# Altium project BGA_RF-ArticGR.PrjPcb
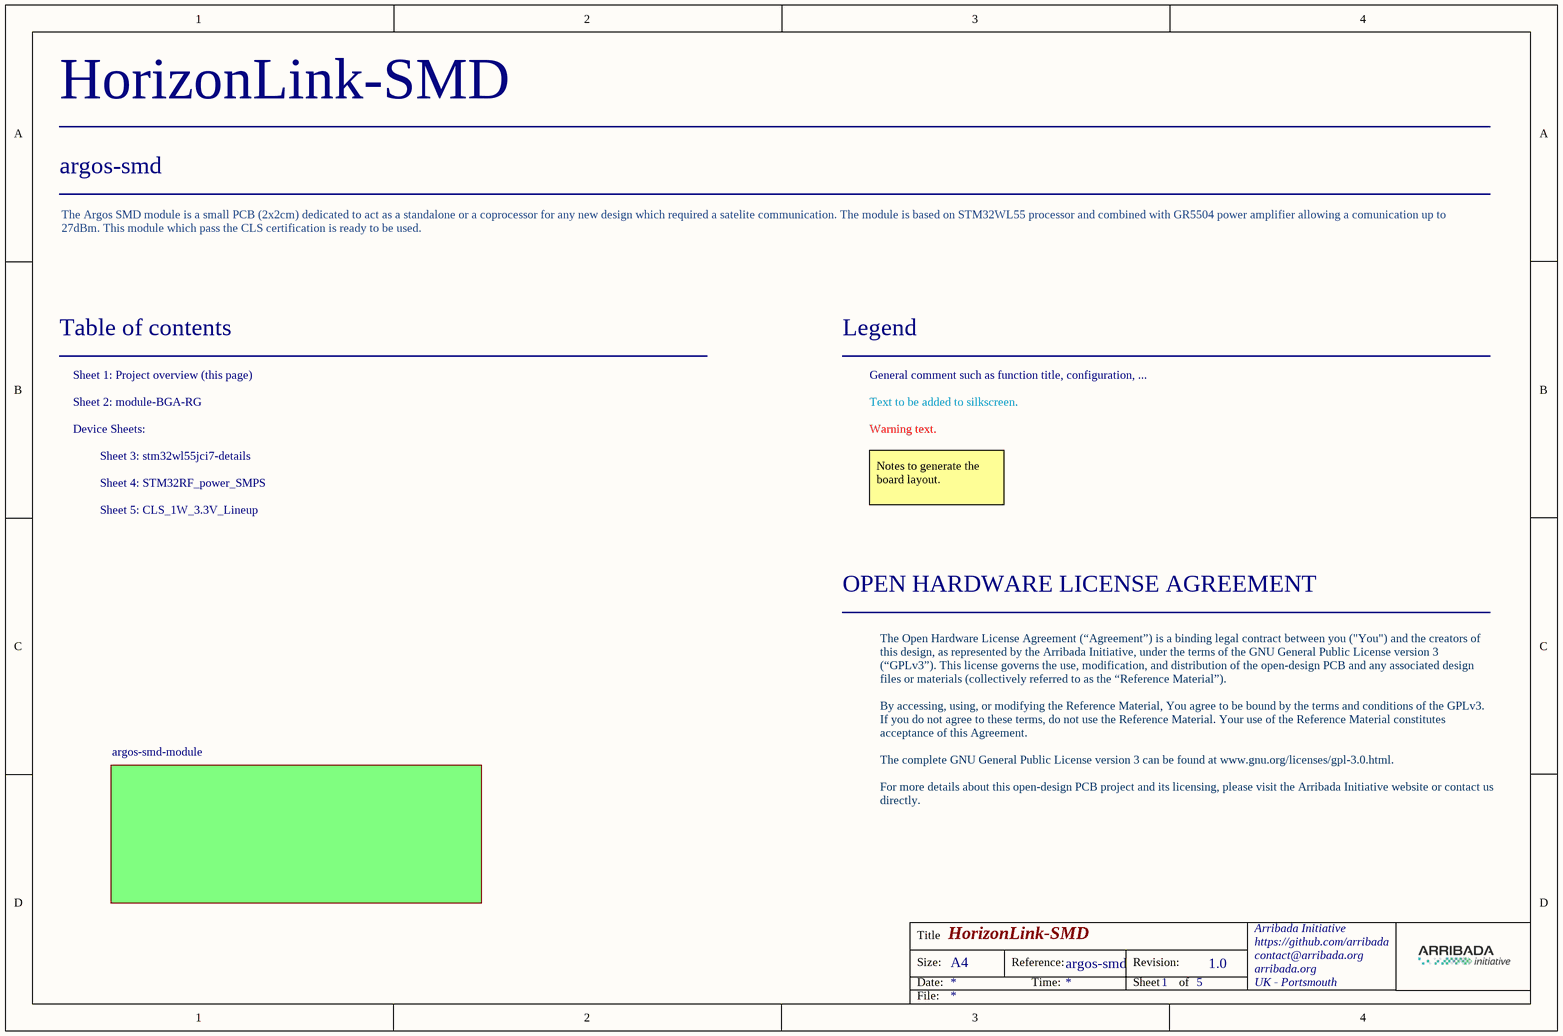
[diagram p0: Project_Overview.SchDoc]
Board_Assembly_Revision: 1.0; Board_Document_Date: 06/2024; Board_Name: HorizonLink-SMD; Board_Reference: argos-smd
2 sheets, 18 parts. Net scope: global (net labels, ports and power ports of the same name join across sheets).
Board file: module-BGA_RG-4layers_v2.1.PcbDoc
Sheets:
  Project_Overview.SchDoc
    argos-smd-module = module-BGA-RG.SchDoc

## Sheet Project_Overview.SchDoc
size A4; Organization: Arribada Initiative; Address1: https://github.com/arribada; Address2: contact@arribada.org; Address3: arribada.org; Address4: UK - Portsmouth; DocumentNumber: 1; SheetNumber: 1; SheetTotal: 5

### Sub-sheets
argos-smd-module = module-BGA-RG.SchDoc: no entries

### Notes on the sheet
- The Argos SMD module is a small PCB (2x2cm) dedicated to act as a standalone or a coprocessor for any new design which required a satelite communication. The module is based on STM32WL55 processor and combined with GR5504 power amplifier allowing a comunication up to 27dBm. This module which pass the CLS certification is ready to be used.
- Table of contents
- Sheet 1: Project overview (this page)
- Legend
- General comment such as function title, configuration, ...
- Sheet 2: module-BGA-RG
- Device Sheets:
- Text to be added to silkscreen.
- Warning text.
- Sheet 3: stm32wl55jci7-details
- Sheet 5: CLS_1W_3.3V_Lineup
- Sheet 4: STM32RF_power_SMPS
- Notes to generate the board layout.
- OPEN HARDWARE LICENSE AGREEMENT
- The Open Hardware License Agreement (“Agreement”) is a binding legal contract between you ("You") and the creators of this design, as represented by the Arribada Initiative, under the terms of the GNU General Public License version 3 (“GPLv3”). This license governs the use, modification, and distribution of the open-design PCB and any associated design files or materials (collectively referred to as the “Reference Material”).
  By accessing, using, or modifying the Reference Material, You agree to be bound by the terms and conditions of the GPLv3. If you do not agree to these terms, do not use the Reference Material. Your use of the Reference Material constitutes acceptance of this Agreement.
  The complete GNU General Public License version 3 can be found at www.gnu.org/licenses/gpl-3.0.html.
  For more details about this open-design PCB project and its licensing, please visit the Arribada Initiative website or contact us directly.
- Title
- Size:
- Date:
- A4
- Reference:
- Time:
- Revision:
- Sheet
- of
- File:

## Sheet module-BGA-RG.SchDoc
size A3; DocumentNumber: 2; SheetNumber: 2; SheetTotal: 5; Organization: Arribada Initiative; Address1: https://github.com/arribada; Address2: contact@arribada.org; Address3: arribada.org; Address4: UK - Porthmouth
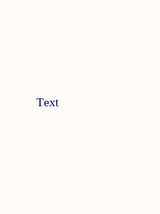
[diagram p1: module-BGA-RG.SchDoc, left]
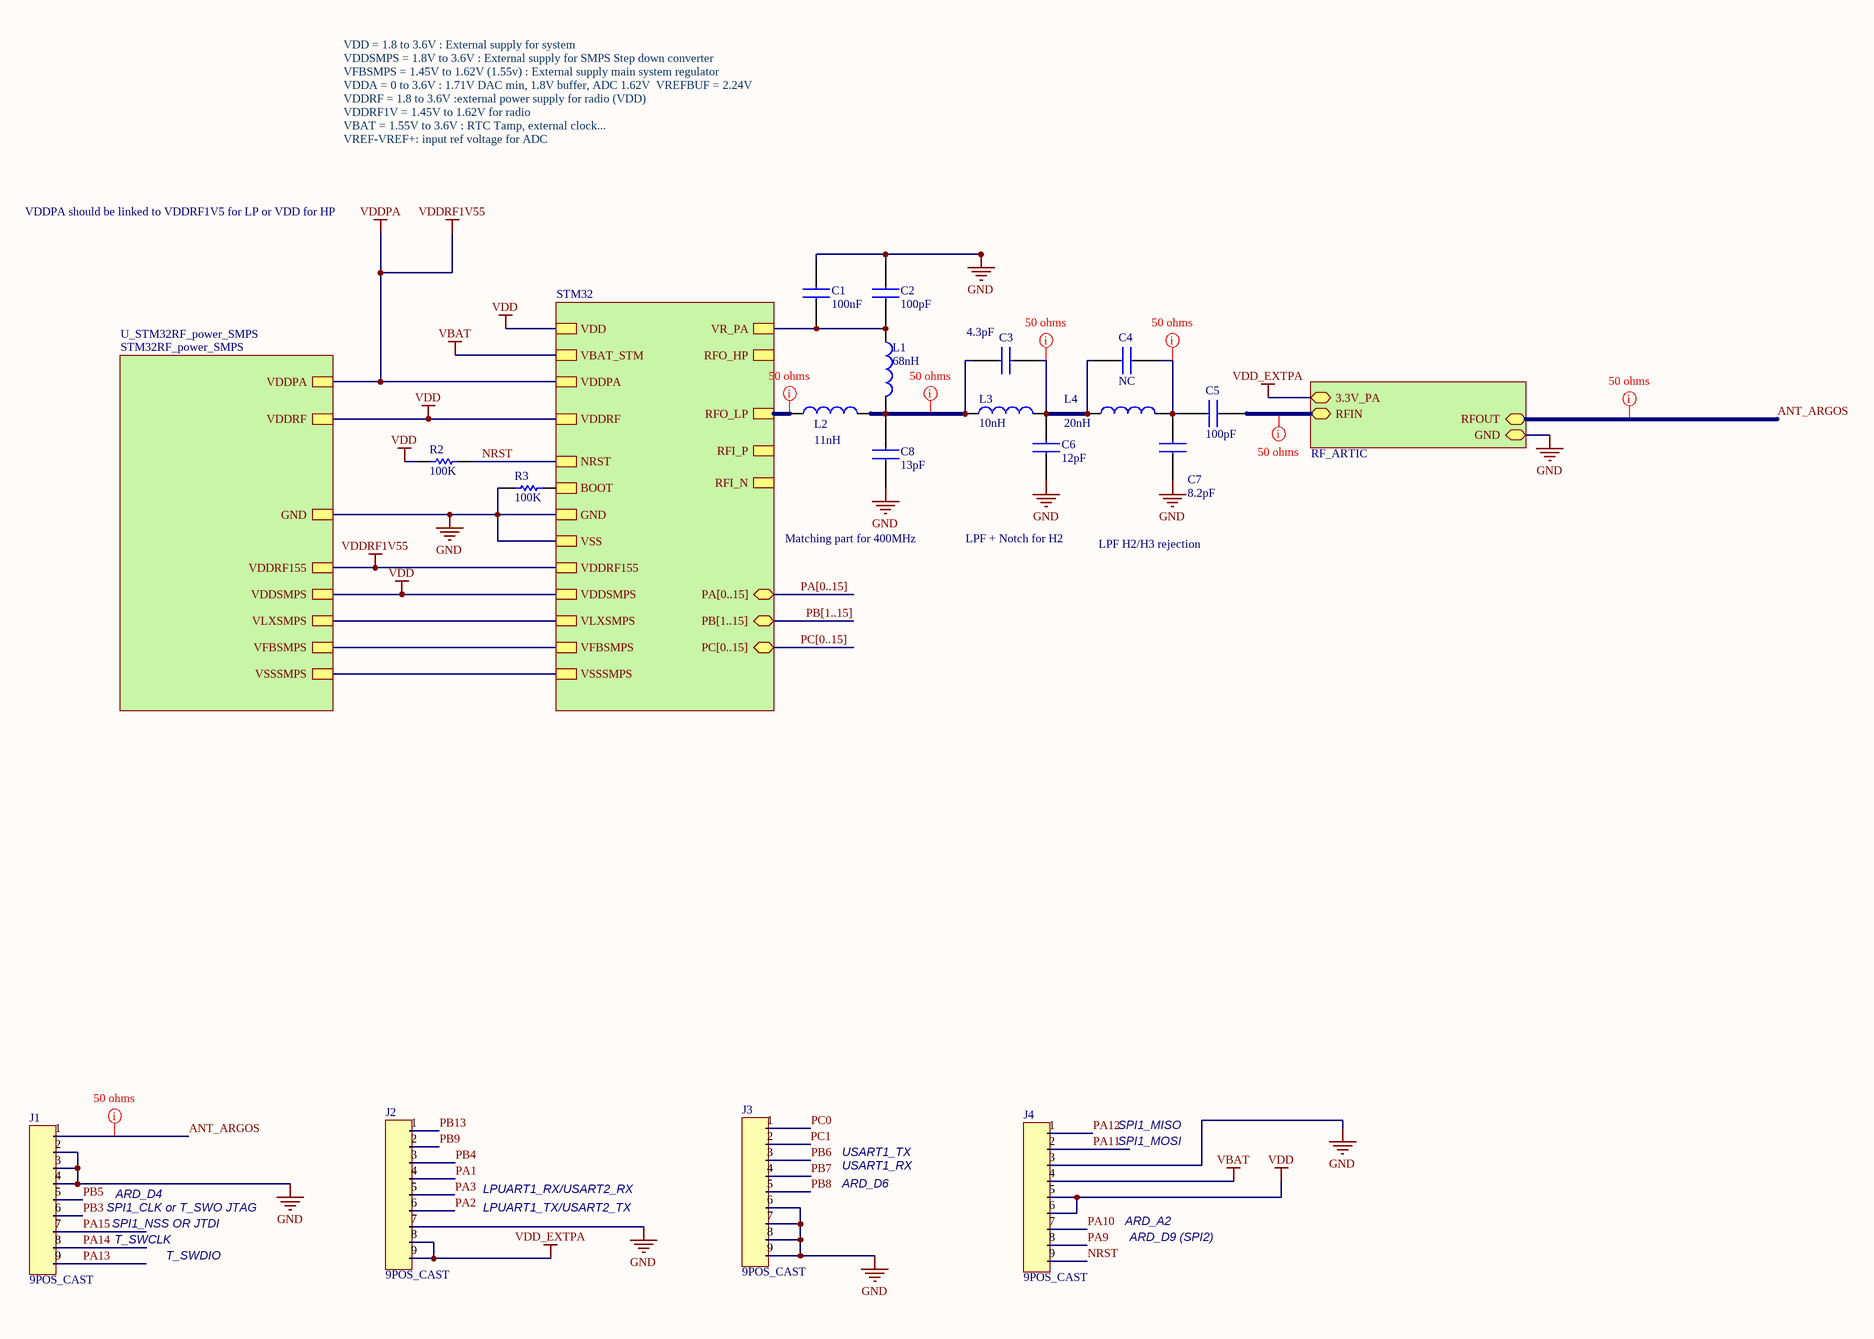
[diagram p2: module-BGA-RG.SchDoc, right]

### Parts
C1  100nF  [CAPC0603X33N]
C2  100pF  [CAPC0603X33N]
C3  Capacitance: 4.3pF  [CAPC1005X55N]  (hidden comment: GRM1555C1H4R3BA01D)
C4  value NC  [CAPC1005X55N]  (hidden comment: CAP-NC-0402)
C5  Capacitance: 100pF  [CAPC1005X55N]  (hidden comment: GCM1555C1H101JA16D)
C6  value 12pF  [CAPC1005X55N]  (hidden comment: GCM1555C1H120GA16D)
C7  value 8.2pF  [CAPC1005X55N]  (hidden comment: GCM1555C1H8R2CA16J)
C8  value 13pF  [CAPC1005X55N]  (hidden comment: GRM1555C1H130GA01D)
J1  9POS_CAST  [9POS_VIA_0.6]
J2  9POS_CAST  [9POS_VIA_0.6]
J3  9POS_CAST  [9POS_VIA_0.6]
J4  9POS_CAST  [9POS_VIA_0.6]
L1  value 68nH  [LQG15WH0N7B02D]  (hidden comment: LQG15HN68NJ02D)
L2  value 11nH  [LQW15CNR20J00B]  (hidden comment: LQG15WZ11NJ02D)
L3  10nH  [LQG15WH0N7B02D]
L4  value 20nH  [LQW15CNR20J00B]  (hidden comment: LQG15WH20NJ02D)
R2  100K  [RESC0603X28N]
R3  100K  [RESC0603X28N]

### Sub-sheets
RF_ARTIC = CLS_1W_3.3V_Lineup (file not in this document): RFIN (bidir), 3.3V_PA (bidir), RFOUT (bidir), GND (bidir)
STM32 = stm32wl55jci7-details (file not in this document): GND, VDDSMPS, VLXSMPS, VFBSMPS, VSSSMPS, VDDRF155, VDDPA, VDDRF, VR_PA, RFO_HP, RFO_LP, RFI_P, RFI_N, VSS, BOOT, NRST, VDD, VBAT_STM, PA[0..15] (bidir), PB[1..15] (bidir), PC[0..15] (bidir)
U_STM32RF_power_SMPS = STM32RF_power_SMPS (file not in this document): GND, VSSSMPS, VDDPA, VDDRF, VDDSMPS, VDDRF155, VLXSMPS, VFBSMPS

### Nets
GND: C1.1 C2.1 C6.1 C7.1 C8.1 J1.2 J1.3 J1.4 J2.7 J3.6 J3.7 J3.8 J3.9 J4.3 R3.1 ; sheet U_STM32RF_power_SMPS/GND, sheet STM32/GND, sheet STM32/VSS, sheet RF_ARTIC/GND
VBAT: J4.4 ; sheet STM32/VBAT_STM
VDD: J4.5 J4.6 R2.1 ; sheet U_STM32RF_power_SMPS/VDDRF, sheet U_STM32RF_power_SMPS/VDDSMPS, sheet STM32/VDDSMPS, sheet STM32/VDDRF, sheet STM32/VDD
VDD_EXTPA: J2.8 J2.9 ; sheet RF_ARTIC/3.3V_PA
VDDPA: sheet U_STM32RF_power_SMPS/VDDPA, sheet U_STM32RF_power_SMPS/VDDRF155, sheet STM32/VDDRF155, sheet STM32/VDDPA  [also labelled VDDRF1V55]
ANT_ARGOS: J1.1 ; sheet RF_ARTIC/RFOUT
NRST: J4.9 R2.2 ; sheet STM32/NRST
PA1: J2.4
PA2: J2.6
PA3: J2.5
PA9: J4.8
PA10: J4.7
PA11: J4.2
PA12: J4.1
PA13: J1.9
PA14: J1.8
PA15: J1.7
PB3: J1.6
PB4: J2.3
PB5: J1.5
PB6: J3.3
PB7: J3.4
PB8: J3.5
PB9: J2.2
PB13: J2.1
PC0: J3.1
PC1: J3.2
NetC1_2: C1.2 C2.2 L1.1 ; sheet STM32/VR_PA
NetC3_1: C3.1 C8.2 L1.2 L2.2 L3.1
NetC3_2: C3.2 C4.1 C6.2 L3.2 L4.1
NetC4_2: C4.2 C5.1 C7.2 L4.2
NetC5_2: C5.2 ; sheet RF_ARTIC/RFIN
NetL2_1: L2.1 ; sheet STM32/RFO_LP
NetR3_2: R3.2 ; sheet STM32/BOOT
(unnamed): sheet U_STM32RF_power_SMPS/VSSSMPS, sheet STM32/VSSSMPS
(unnamed): sheet U_STM32RF_power_SMPS/VLXSMPS, sheet STM32/VLXSMPS
(unnamed): sheet U_STM32RF_power_SMPS/VFBSMPS, sheet STM32/VFBSMPS

### Buses and harness runs
bus PA[0..15] = sheet STM32/PA[0..15]
bus PB[1..15] = sheet STM32/PB[1..15]
bus PC[0..15] = sheet STM32/PC[0..15]

### Layout directives
net class 50Ohms; rule Impedance Constraint [Min = 50.00    Max = 50.00    ]: ANT_ARGOS, NetC3_1, NetC3_2, NetC4_2, NetC5_2, NetL2_1

### Notes on the sheet
- VDD = 1.8 to 3.6V : External supply for system
  VDDSMPS = 1.8V to 3.6V : External supply for SMPS Step down converter
  VFBSMPS = 1.45V to 1.62V (1.55v) : External supply main system regulator
  VDDA = 0 to 3.6V : 1.71V DAC min, 1.8V buffer, ADC 1.62V  VREFBUF = 2.24V
  VDDRF = 1.8 to 3.6V :external power supply for radio (VDD)
  VDDRF1V = 1.45V to 1.62V for radio
  VBAT = 1.55V to 3.6V : RTC Tamp, external clock...
  VREF-VREF+: input ref voltage for ADC
- VDDPA should be linked to VDDRF1V5 for LP or VDD for HP
- Matching part for 400MHz
- LPF + Notch for H2
- LPF H2/H3 rejection
- Text
- SPI1_MISO
- LPUART1_RX/USART2_RX
- USART1_RX
- USART1_TX
- ARD_D6
- SPI1_MOSI
- T_SWCLK
- ARD_D4
- T_SWDIO
- SPI1_NSS OR JTDI
- SPI1_CLK or T_SWO JTAG
- LPUART1_TX/USART2_TX
- ARD_A2
- ARD_D9 (SPI2)
- Title
- Size:
- Date:
- A3
- Reference:
- Time:
- Revision:
- Sheet
- of
- File:

### Library data of the parts
C1 = GRM033Z71C104KE14D: Multilayer Ceramic Capacitors MLCC - SMD/SMT .1UF     16V   10%        0201; Manufacturer_Name: Murata Electronics; Manufacturer 1: Murata; Geometry.Height: 0.33mm; Description 1: Cap Ceramic 0.1uF 16V X7R 10% Pad SMD 0201 125C T/R; Mouser Part Number: 81-GRM033Z71C104KE4D; Mouser Price/Stock: https://www.mouser.co.uk/ProductDetail/Murata-Electronics/GRM033Z71C104KE14D?qs=lEfY3O89AqkdMqrSfAAk2w%3D%3D; Manufacturer_Part_Number: GRM033Z71C104KE14D; Datasheet Link: http://www.murata.com/~/media/webrenewal/support/library/catalog/products/capacitor/mlcc/c02e.pdf; Supplier 1: Mouser; Supplier Part Number 1: 81-GRM033Z71C104KE4D; Manufacturer Part Number 1: GRM033Z71C104KE14D; RoHS 1: Yes; Category 1: Ceramic Capacitors; Stock 1: 739403; Pricing 1: 1=0,1, 10=0,017, 50=0,017, 100=0,01, 1000=0,008, 10000=0,006 (USD); Case/Package: 0201; RoHS Compliant: Yes
C2 = GRM0335C1E101JA01D: Multilayer Ceramic Capacitors MLCC - SMD/SMT 100PF 25V 5% 0201; Manufacturer_Name: Murata Electronics; Manufacturer 1: Murata; Description 1: 0201 100 pF 25 V ±5% Tolerance C0G SMT Multilayer Ceramic Capacitor; Dielectric: C0G; Datasheet Link: http://www.murata.com/~/media/webrenewal/support/library/catalog/products/capacitor/mlcc/c02e.pdf; Height: 0.33mm; Manufacturer_Part_Number: GRM0335C1E101JA01D; Mouser Part Number: 81-GRM0335C1E101JA1D; Mouser Price/Stock: https://www.mouser.co.uk/ProductDetail/Murata-Electronics/GRM0335C1E101JA01D?qs=lsk7mV%2FgRRIhY4z12C%2FxnQ%3D%3D; Arrow Part Number: GRM0335C1E101JA01D; Arrow Price/Stock: https://www.arrow.com/en/products/grm0335c1e101ja01d/murata-manufacturing; Supplier 1: Mouser; Supplier Part Number 1: 81-GRM0335C1E101JA1D; Manufacturer Part Number 1: GRM0335C1E101JA01D; RoHS 1: Yes; Category 1: Ceramic Capacitors; Stock 1: 2143436; Pricing 1: 1=0,1, 10=0,006, 50=0,006, 100=0,004, 1000=0,003, 10000=0,003 (USD); Mount: Surface Mount; Case/Package: 0201; Case Code (Metric): 0603; Case Code (Imperial): 0201; Min Operating Temperature: -55°C; Max Operating Temperature: 125°C; Package Quantity: 1; Packaging: Tape and Reel; Voltage Rating: 25V; Voltage Rating (DC): 25V; Termination: SMD/SMT; Series: GRM; Capacitance: 100pF; Tolerance: 5%; Voltage: 25V; Construction: Flat; Length: 0.6mm; Width: 0.012inch; Depth: 0.3mm; Thickness: 0.013inch; Radiation Hardening: No; Reach SVHC Compliant: No; Lead Free: Lead Free; RoHS Compliant: Yes; ComponentLink1URL: https://datasheet.ciiva.com/16497/grm0335c1e101ja01-01-16497112.pdf?src-supplier=Future+Electronics; ComponentLink1Description: https://datasheet.ciiva.com/16497/grm0335c1e101ja01-01-16497112.pdf?src-supplier=Future+Electronics; ComponentLink2URL: https://datasheet.ciiva.com/18697/product-18697797.pdf?src-supplier=Digi-Key; ComponentLink2Description: https://datasheet.ciiva.com/18697/product-18697797.pdf?src-supplier=Digi-Key; Value: 100pF
C3 = GRM1555C1H4R3BA01D: Multilayer Ceramic Capacitors MLCC - SMD/SMT 4.3 pF 50 VDC 0.1 pF 0402 C0G (NP0); Manufacturer 1: Murata; Description 1: CAP CER 4.3PF 50V C0G/NP0 0402; Voltage Rating: 50V; Value: 4.3pF; Height: 0.5mm; Supplier 1: Digi-Key; Supplier Part Number 1: 490-6243-1-ND; Manufacturer Part Number 1: GRM1555C1H4R3BA01D; RoHS 1: Yes; Category 1: Ceramic Capacitors; Pricing 1: 1=0,1, 10=0,051, 50=0,0278, 100=0,0227, 500=0,01624, 1000=0,01276, 2500=0,0116, 5000=0,01067 (USD); Mount: Surface Mount; Case/Package: 0402; Min Operating Temperature: -55°C; Max Operating Temperature: 125°C; Packaging: Tape and Reel; Package Quantity: 1; Dielectric: C0G; Voltage Rating (DC): 50V; Series: GRM; Length: 1mm; Width: 0.02inch; Thickness: 0.022inch; RoHS Compliant: Yes; ComponentLink1URL: https://datasheet.ciiva.com/6270/grm1555c1h4r1wa01-01-6270851.pdf?src-supplier=Digi-Key; ComponentLink1Description: https://datasheet.ciiva.com/6270/grm1555c1h4r1wa01-01-6270851.pdf?src-supplier=Digi-Key; ComponentLink2URL: https://datasheet.ciiva.com/11613/product-11613482.pdf?src-supplier=Avnet; ComponentLink2Description: https://datasheet.ciiva.com/11613/product-11613482.pdf?src-supplier=Avnet; Stock 1: 166304; Case Code (Metric): 1005; Case Code (Imperial): 0402; Termination: SMD/SMT; Voltage: 50V; Construction: Flat; Depth: 0.5mm; Radiation Hardening: No; Lead Free: Lead Free; ComponentLink3URL: https://datasheet.ciiva.com/18184/getdatasheetpartid-319930-18184404.pdf?src-supplier=Verical; ComponentLink3Description: https://datasheet.ciiva.com/18184/getdatasheetpartid-319930-18184404.pdf?src-supplier=Verical; ComponentLink4URL: https://datasheet.ciiva.com/6270/partnumbering-e-01-6270857.pdf?src-supplier=Digi-Key; ComponentLink4Description: https://datasheet.ciiva.com/6270/partnumbering-e-01-6270857.pdf?src-supplier=Digi-Key; ComponentLink5URL: https://datasheet.ciiva.com/6270/partnumbering-e-01-6270860.pdf?src-supplier=Digi-Key; ComponentLink5Description: https://datasheet.ciiva.com/6270/partnumbering-e-01-6270860.pdf?src-supplier=Digi-Key
C4 = CAP-NC-0402: CMS 0402 Non Connected
C5 = GCM1555C1H101JA16D: Multilayer Ceramic Capacitors MLCC - SMD/SMT 100 pF 50 VDC 5% 0402 C0G (NP0) AEC-Q200; Manufacturer 1: Murata; Description 1: 0402 100 pF 50 V ±5 % Tolerance C0G SMT Multilayer Ceramic Capacitor; Voltage Rating: 50V; Value: 100pF; Supplier 1: Mouser; Supplier Part Number 1: 81-GCM1555C1H101JA6D; Manufacturer Part Number 1: GCM1555C1H101JA16D; RoHS 1: Yes; Category 1: Ceramic Capacitors; Stock 1: 5688; Pricing 1: 1=0,1, 10=0,023, 50=0,023, 100=0,014, 1000=0,011, 10000=0,006 (USD); Mount: Surface Mount; Case/Package: 0402; Case Code (Metric): 1005; Case Code (Imperial): 0402; Weight: 0.000212oz; Min Operating Temperature: -55°C; Max Operating Temperature: 125°C; Tolerance: 5%; Packaging: Tape and Reel; Dielectric: C0G; Voltage: 50V; Termination: SMD/SMT; Voltage Rating (DC): 50V; Package Quantity: 10000; Series: GCM; Length: 1mm; Width: 0.02inch; Height: 0.5mm; Thickness: 0.022inch; Depth: 0.5mm; Ratings: AEC-Q200; Radiation Hardening: No; Reach SVHC Compliant: No; Lead Free: Lead Free; RoHS Compliant: Yes; ComponentLink1URL: https://datasheet.ciiva.com/26889/getdatasheetpartid-748988-26889122.pdf?src-supplier=Verical; ComponentLink1Description: https://datasheet.ciiva.com/26889/getdatasheetpartid-748988-26889122.pdf?src-supplier=Verical
C6 = GCM1555C1H120GA16D: Multilayer Ceramic Capacitors MLCC - SMD/SMT 12 pF 50 VDC 2% 0402 C0G (NP0) AEC-Q200; Manufacturer_Name: Murata Electronics; Manufacturer 1: Murata; Description 1: Cap Ceramic 12pF 50V C0G 2% Pad SMD 0402 125C Automotive T/R; Datasheet Link: https://eu.mouser.com/datasheet/2/281/GCM1555C1H120GA16-01-1064161.pdf; Height: 0.55mm; Manufacturer_Part_Number: GCM1555C1H120GA16D; Arrow Part Number: GCM1555C1H120GA16D; Arrow Price/Stock: https://www.arrow.com/en/products/gcm1555c1h120ga16d/murata-manufacturing?region=nac; Supplier 1: Mouser; Supplier Part Number 1: 81-GCM1555C1H120GA6D; Manufacturer Part Number 1: GCM1555C1H120GA16D; RoHS 1: Yes; Category 1: Ceramic Capacitors; Stock 1: 28183; Pricing 1: 1=0,1, 10=0,034, 50=0,034, 100=0,02, 1000=0,016, 10000=0,012 (USD); RoHS Compliant: Yes
C7 = GCM1555C1H8R2CA16J: Multilayer Ceramic Capacitors MLCC - SMD/SMT 8.2 pF 50 VDC 0.25 pF 0402 C0G (NP0) AEC-Q200; Manufacturer 1: Murata; Description 1: Cap Auto-grade 8.2PF 50VDC C0G 0.25PF SMD 0402; Supplier 1: Mouser; Supplier Part Number 1: 81-GCM1555C1H8R2CA6J; Manufacturer Part Number 1: GCM1555C1H8R2CA16J; RoHS 1: Yes; Category 1: Ceramic Capacitors; Stock 1: 93627; Pricing 1: 1=0,1, 10=0,052, 50=0,052, 100=0,024, 1000=0,014, 10000=0,01 (USD); RoHS Compliant: Yes
C8 = GRM1555C1H130GA01D: Multilayer Ceramic Capacitors MLCC - SMD/SMT 13 pF 50 VDC 2% 0402 C0G (NP0); Manufacturer_Name: Murata Electronics; Manufacturer 1: Murata; Description 1: 0402 13 pF 50 V ±2% Tolerance C0G SMT Multilayer Ceramic Capacitor; Voltage Rating: 50V; Datasheet Link: http://www.murata.com/~/media/webrenewal/support/library/catalog/products/capacitor/mlcc/c02e.pdf; Height: 0.55mm; Manufacturer_Part_Number: GRM1555C1H130GA01D; Mouser Part Number: 81-GRM1555C1H130GA1D; Mouser Price/Stock: https://www.mouser.com/Search/Refine.aspx?Keyword=81-GRM1555C1H130GA1D; Arrow Part Number: GRM1555C1H130GA01D; Arrow Price/Stock: https://www.arrow.com/en/products/grm1555c1h130ga01d/murata-manufacturing; Supplier 1: Mouser; Supplier Part Number 1: 81-GRM1555C1H130GA1D; Manufacturer Part Number 1: GRM1555C1H130GA01D; RoHS 1: Yes; Category 1: Ceramic Capacitors; Stock 1: 26120; Pricing 1: 1=0,13, 10=0,088, 50=0,088, 100=0,042, 1000=0,024, 10000=0,018 (USD); Mount: Surface Mount; Case/Package: 0402; Case Code (Imperial): 0402; Case Code (Metric): 1005; Material: Ceramic; Min Operating Temperature: -55°C; Max Operating Temperature: 125°C; Tolerance: 2%; Packaging: Tape and Reel; Capacitance: 13pF; Voltage Rating (DC): 50V; Package Quantity: 1; Dielectric: C0G; Termination: SMD/SMT; Series: GRM; Construction: Flat; Length: 1mm; Width: 0.5mm; Thickness: 0.022inch; Depth: 0.5mm; Radiation Hardening: No; Lead Free: Lead Free; RoHS Compliant: Yes; ComponentLink1URL: https://datasheet.ciiva.com/29540/grm1555c1h130ga01-01-29540650.pdf?src-supplier=Digi-Key; ComponentLink1Description: https://datasheet.ciiva.com/29540/grm1555c1h130ga01-01-29540650.pdf?src-supplier=Digi-Key; ComponentLink2URL: https://datasheet.ciiva.com/5451/product-5451159.pdf?src-supplier=Mouser; ComponentLink2Description: https://datasheet.ciiva.com/5451/product-5451159.pdf?src-supplier=Mouser; ComponentLink3URL: https://datasheet.ciiva.com/29540/partnumbering-e-01-29540651.pdf?src-supplier=Digi-Key; ComponentLink3Description: https://datasheet.ciiva.com/29540/partnumbering-e-01-29540651.pdf?src-supplier=Digi-Key; ComponentLink4URL: https://datasheet.ciiva.com/29540/partnumbering-e-01-29540652.pdf?src-supplier=Digi-Key; ComponentLink4Description: https://datasheet.ciiva.com/29540/partnumbering-e-01-29540652.pdf?src-supplier=Digi-Key
J1-J4 = 9POS_CAST: 9 POS Castellated connector with VIA 0.6
L1 = LQG15HN68NJ02D: Inductor RF Chip Multi-Layer 68nH 5% 100MHz 8Q-Factor Air 180mA 1.25Ohm DCR 0402 Paper T/R; Manufacturer 1: Murata; Category 1: Fixed Inductors; DC Resistance (DCR): 1.25R; Q Factor: 8; Self Resonant Frequency: 800MHz; Shielding: Unshielded; Inductor Type: MONOLITHIC; Supplier 1: Digi-Key; Supplier Part Number 1: 490-1095-1-ND; Manufacturer Part Number 1: LQG15HN68NJ02D; RoHS 1: Yes; Description 1: Inductor RF Chip Multi-Layer 68nH 5% 100MHz 8Q-Factor Air 180mA 1.25Ohm DCR 0402 Paper T/R; Mount: Surface Mount; Case/Package: 0402; Number of Pins: 2; Core Material: Air; Case Code (Metric): 1005; Case Code (Imperial): 0402; Min Operating Temperature: -55°C; Max Operating Temperature: 125°C; Tolerance: 5%; Inductance: 68nH; Max DC Current: 180mA; Inductance Tolerance: 5%; Packaging: Tape and Reel; Package Quantity: 1; Current Rating: 180mA; Test Frequency: 100MHz; Termination: SMD/SMT; DC Current: 180mA; Series: LQG15HS; Length: 0.039inch; Width: 0.02inch; Height: 0.5mm; Height - Seated (Max): 0.022inch; Depth: 0.55mm; Reach SVHC Compliant: No; Military Standard: Not; Lead Free: Lead Free; RoHS Compliant: Yes; ComponentLink1URL: https://datasheet.ciiva.com/11801/0900766b80f10808-11801435.pdf?src-supplier=Rs; ComponentLink1Description: https://datasheet.ciiva.com/11801/0900766b80f10808-11801435.pdf?src-supplier=Rs; ComponentLink2URL: https://datasheet.ciiva.com/8002/66026-8002542.pdf?src-supplier=Element14; ComponentLink2Description: https://datasheet.ciiva.com/8002/66026-8002542.pdf?src-supplier=Element14; ComponentLink3URL: https://datasheet.ciiva.com/29696/l0075s0083lqg15hn-29696694.pdf?src-supplier=Digi-Key; ComponentLink3Description: https://datasheet.ciiva.com/29696/l0075s0083lqg15hn-29696694.pdf?src-supplier=Digi-Key; ComponentLink4URL: https://datasheet.ciiva.com/6705/l0075s0083lqg15hn-6705208.pdf?src-supplier=Digi-Key; ComponentLink4Description: https://datasheet.ciiva.com/6705/l0075s0083lqg15hn-6705208.pdf?src-supplier=Digi-Key; ComponentLink5URL: https://datasheet.ciiva.com/29696/l0075s0083lqg15hn-29696695.pdf?src-supplier=Digi-Key; ComponentLink5Description: https://datasheet.ciiva.com/29696/l0075s0083lqg15hn-29696695.pdf?src-supplier=Digi-Key; ComponentLink6URL: https://datasheet.ciiva.com/8510/l0075s0083lqg15hn-8510777.pdf?src-supplier=Avnet; ComponentLink6Description: https://datasheet.ciiva.com/8510/l0075s0083lqg15hn-8510777.pdf?src-supplier=Avnet
L2 = LQG15WZ11NJ02D: Inductor RF Chip Multi-Layer 11nH 5% 0402 Paper T/R; Manufacturer 1: Murata; Description 1: Ind Chip Multi-Layer 11nH 5% 0402 Paper T/R; Category 1: Fixed Inductors; Core Material: Air; Inductance: 10nH; Current Rating: 450mA; Shielding: Unshielded; DC Resistance (DCR): 220mR; Self Resonant Frequency: 3GHz; Test Frequency: 100MHz; Supplier 1: Digi-Key; Supplier Part Number 1: 490-15246-1-ND; Manufacturer Part Number 1: LQG15WZ11NJ02D; RoHS 1: Yes; Mount: Surface Mount; Case/Package: 0402; Case Code (Imperial): 0402; Case Code (Metric): 1005; Min Operating Temperature: -55°C; Max Operating Temperature: 125°C; Packaging: Cut Tape; Tolerance: 5%; Series: LQG15; Ratings: AEC-Q200; RoHS Compliant: Yes; ComponentLink1URL: http://search.murata.co.jp/Ceramy/image/img/P02/JELF243B-9117.pdf?src-supplier=Digi-Key; ComponentLink1Description: http://search.murata.co.jp/Ceramy/image/img/P02/JELF243B-9117.pdf?src-supplier=Digi-Key
L3 = LQG15HS10NJ02D: Inductor RF Chip Multi-Layer 10nH 5% 100MHz 8Q-Factor Air 300mA 260mOhm DCR 0402 Paper T/R; Manufacturer: Murata; Self Resonant Frequency: 3.4GHz; Q Factor: 8; Shielding: Unshielded; DC Resistance (DCR): 260mR; Supplier 1: Arrow Electronics; Manufacturer Part Number: LQG15HS10NJ02D; RoHS: Yes; Category: Fixed Inductors; Stock 1: 211215; Pricing 1: 10000=0,0139 (USD); Mount: Surface Mount; Case/Package: 0402; Core Material: Air; Case Code (Metric): 1005; Case Code (Imperial): 0402; Min Operating Temperature: -55°C; Max Operating Temperature: 125°C; Package Quantity: 1; Packaging: Tape and Reel; Tolerance: 5%; Current Rating: 300mA; Inductance: 10nH; Max DC Current: 300mA; Termination: SMD/SMT; Test Frequency: 100MHz; DC Current: 300mA; Series: LQG15HS; Rated Current-Max: 300mA; Length: 0.039inch; Width: 0.02inch; Height: 0.5mm; Height - Seated (Max): 0.022inch; Depth: 0.55mm; Military Standard: Not; Lead Free: Lead Free; RoHS Compliant: Yes; ComponentLink1URL: https://datasheet.ciiva.com/11801/0900766b80f10809-11801401.pdf?src-supplier=Rs; ComponentLink1Description: https://datasheet.ciiva.com/11801/0900766b80f10809-11801401.pdf?src-supplier=Rs; ComponentLink2URL: https://datasheet.ciiva.com/1038/l0075s0083lqg15hs-1038119.pdf?src-supplier=Digi-Key; ComponentLink2Description: https://datasheet.ciiva.com/1038/l0075s0083lqg15hs-1038119.pdf?src-supplier=Digi-Key; ComponentLink3URL: https://datasheet.ciiva.com/1038/l0075s0083lqg15hs-1038118.pdf?src-supplier=Digi-Key; ComponentLink3Description: https://datasheet.ciiva.com/1038/l0075s0083lqg15hs-1038118.pdf?src-supplier=Digi-Key; ComponentLink4URL: https://datasheet.ciiva.com/1038/l0075s0083lqg15hs-1038120.pdf?src-supplier=Digi-Key; ComponentLink4Description: https://datasheet.ciiva.com/1038/l0075s0083lqg15hs-1038120.pdf?src-supplier=Digi-Key; ComponentLink5URL: https://datasheet.ciiva.com/8510/l0075s0083lqg15hs-8510813.pdf?src-supplier=Avnet; ComponentLink5Description: https://datasheet.ciiva.com/8510/l0075s0083lqg15hs-8510813.pdf?src-supplier=Avnet; Value: 10nH; Supplier Part Number 1: LQG15HS10NJ02D
L4 = LQG15WH20NJ02D: Inductor RF Chip, Aec-Q200, 20Nh, 0402, 2.1Ghz Rohs Compliant: Yes; Manufacturer 1: Murata; Description 1: Inductor, Aec-Q200, 20Nh, 0402, 2.1Ghz Rohs Compliant: Yes; Category 1: Fixed Inductors; Tolerance: 5%; Shielding: Unshielded; DC Resistance (DCR): 1.1R; Test Frequency: 100MHz; Supplier 1: Mouser; Supplier Part Number 1: 81-LQG15WH20NJ02D; Manufacturer Part Number 1: LQG15WH20NJ02D; RoHS 1: Yes; Stock 1: 9495; Pricing 1: 1=0,14, 10=0,097, 50=0,097, 100=0,078, 1000=0,06, 10000=0,045 (USD); Mount: Surface Mount; Case/Package: 0402; Min Operating Temperature: -55°C; Max Operating Temperature: 125°C; Series: LQG15; Self Resonant Frequency: 2.1GHz; Inductance: 20nH; Ratings: AEC-Q200; RoHS Compliant: Yes
R2 R3 = CRCW0201100KFNED: Resistors Thick Film  - SMD 1/20watt 100Kohms 1% 200ppm; Manufacturer_Name: Vishay; Datasheet Link: http://www.vishay.com/docs/20035/dcrcwe3.pdf; Height: 0.28mm; Manufacturer_Part_Number: CRCW0201100KFNED; Mouser Part Number: 71-CRCW0201100KFNED; Mouser Price/Stock: https://www.mouser.co.uk/ProductDetail/Vishay-Dale/CRCW0201100KFNED?qs=IQLUlsvFoXuZOEgCEo70BA%3D%3D; Arrow Part Number: CRCW0201100KFNED; Arrow Price/Stock: https://www.arrow.com/en/products/crcw0201100kfned/vishay?region=nac

## Assembly variants
VHF_300: not fitted C11; alternate parts L8 -> LQW15AN4N8B0ZD, L9 -> LQG15HN3N6C02D, C21 -> GRM1555C1H200GA01D, C24 -> GCM1555C1H110FA16D, L10 -> LQW15AN13NG0ZD, C25 -> GRM0225C1E7R0BA03L, C10 -> GRM1555C1H200GA01D, L5 -> LQW15AN13NG0ZD, L4 -> LQG15HN3N6C02D, C17 -> GCM1555C1H110FA16D, C18 -> GRM0225C1E7R0BA03L